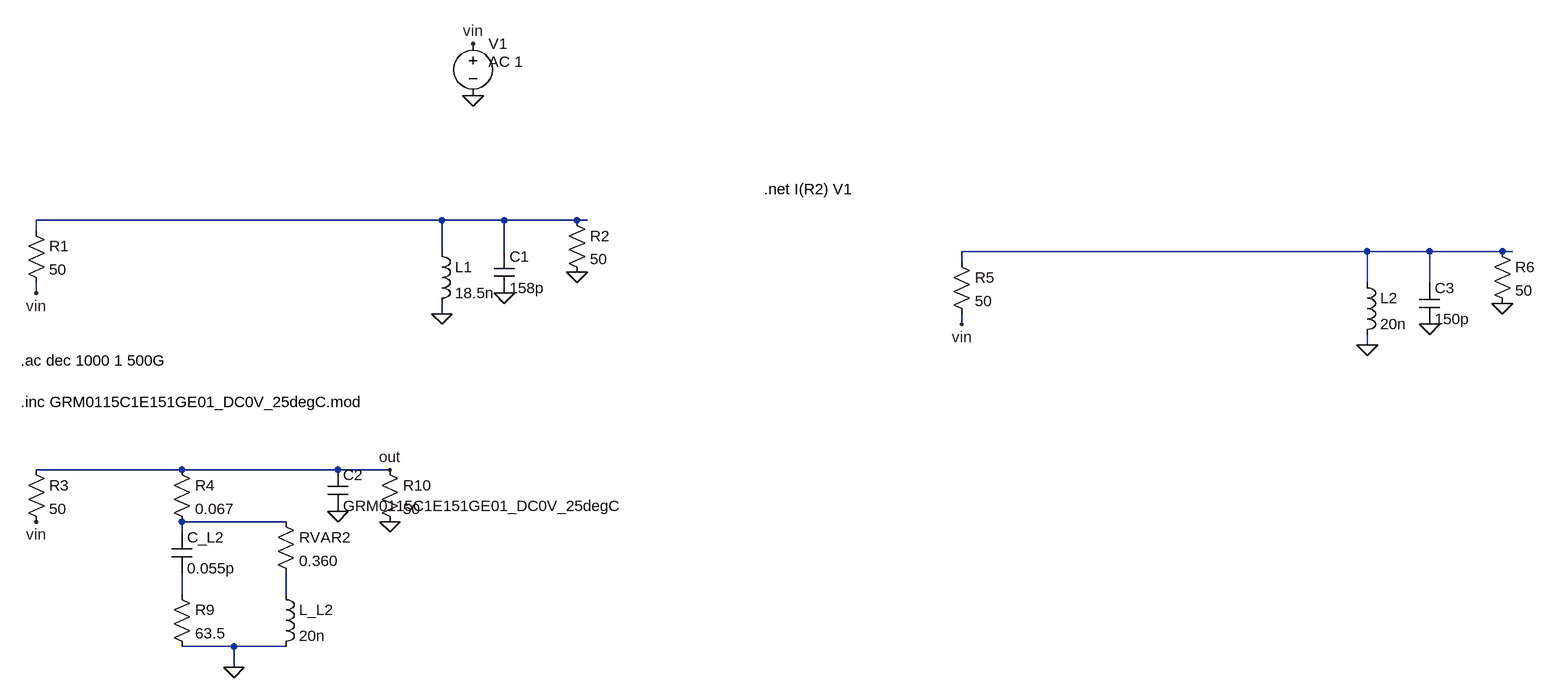
[diagram p0: schematic Filtro_FirstONe.asc]
Filtro_FirstONe.asc, the LTspice schematic file:
Version 4
SHEET 1 2136 1028
WIRE 448 144 -176 144
WIRE 544 144 448 144
WIRE 656 144 544 144
WIRE 672 144 656 144
WIRE -176 160 -176 144
WIRE 448 192 448 144
WIRE 544 192 544 144
WIRE 1872 192 1248 192
WIRE 1968 192 1872 192
WIRE 2080 192 1968 192
WIRE 2096 192 2080 192
WIRE 1248 208 1248 192
WIRE 1872 240 1872 192
WIRE 1968 240 1968 192
WIRE -176 256 -176 240
WIRE 448 288 448 272
WIRE 1248 304 1248 288
WIRE 1872 336 1872 320
WIRE 48 528 -176 528
WIRE 288 528 48 528
WIRE 368 528 288 528
WIRE 208 608 48 608
WIRE 48 624 48 608
WIRE 48 720 48 688
WIRE 208 720 208 688
WIRE 128 800 48 800
WIRE 208 800 128 800
WIRE 128 832 128 800
FLAG 448 288 0
FLAG -176 256 vin
FLAG 496 -48 0
FLAG 496 -128 vin
FLAG 544 256 0
FLAG 656 224 0
FLAG -176 608 vin
FLAG 128 832 0
FLAG 368 608 0
FLAG 288 592 0
FLAG 368 528 out
FLAG 1872 336 0
FLAG 1248 304 vin
FLAG 1968 304 0
FLAG 2080 272 0
SYMBOL ind 432 176 R0
SYMATTR InstName L1
SYMATTR Value 18.5n
SYMBOL cap 528 256 M180
WINDOW 0 24 56 Left 2
WINDOW 3 24 8 Left 2
SYMATTR InstName C1
SYMATTR Value 158p
SYMBOL voltage 496 -144 R0
WINDOW 123 24 44 Left 2
WINDOW 39 0 0 Left 0
SYMATTR Value2 AC 1
SYMATTR InstName V1
SYMATTR Value ""
SYMBOL res -192 144 R0
SYMATTR InstName R1
SYMATTR Value 50
SYMBOL res 640 128 R0
SYMATTR InstName R2
SYMATTR Value 50
SYMBOL res -192 512 R0
SYMATTR InstName R3
SYMATTR Value 50
SYMBOL res 32 512 R0
SYMATTR InstName R4
SYMATTR Value 0.067
SYMBOL cap 32 624 R0
SYMATTR InstName C_L2
SYMATTR Value 0.055p
SYMBOL res 32 704 R0
SYMATTR InstName R9
SYMATTR Value 63.5
SYMBOL res 192 592 R0
SYMATTR InstName RVAR2
SYMATTR Value 0.360
SYMBOL ind 192 704 R0
SYMATTR InstName L_L2
SYMATTR Value 20n
SYMBOL cap 272 528 R0
SYMATTR InstName C2
SYMATTR Prefix X
SYMATTR Value GRM0115C1E151GE01_DC0V_25degC
SYMBOL res 352 512 R0
SYMATTR InstName R10
SYMATTR Value 50
SYMBOL ind 1856 224 R0
SYMATTR InstName L2
SYMATTR Value 20n
SYMBOL cap 1952 304 M180
WINDOW 0 24 56 Left 2
WINDOW 3 24 8 Left 2
SYMATTR InstName C3
SYMATTR Value 150p
SYMBOL res 1232 192 R0
SYMATTR InstName R5
SYMATTR Value 50
SYMBOL res 2064 176 R0
SYMATTR InstName R6
SYMATTR Value 50
TEXT -200 360 Left 2 !.ac dec 1000 1 500G
TEXT 944 96 Left 2 !.net I(R2) V1
TEXT -200 424 Left 2 !.inc GRM0115C1E151GE01_DC0V_25degC.mod

The netlist it stands for:
* Filtro_FirstONe.asc
L1 N001 0 18.5n
C1 0 N001 158p
V1 vin 0 AC 1
R1 N001 vin 50
R2 N001 0 50
R3 out vin 50
R4 out N003 0.067
C_L2 N003 N004 0.055p
R9 N004 0 63.5
RVAR2 N003 N005 0.360
L_L2 N005 0 20n
XC2 out 0 GRM0115C1E151GE01_DC0V_25degC  ; pins A B
R10 out 0 50
L2 N002 0 20n
C3 0 N002 150p
R5 N002 vin 50
R6 N002 0 50
.ac dec 1000 1 500G
.net I(R2) V1
.inc GRM0115C1E151GE01_DC0V_25degC.mod
.backanno
.end